# Altium project Tay cam.PrjPcb
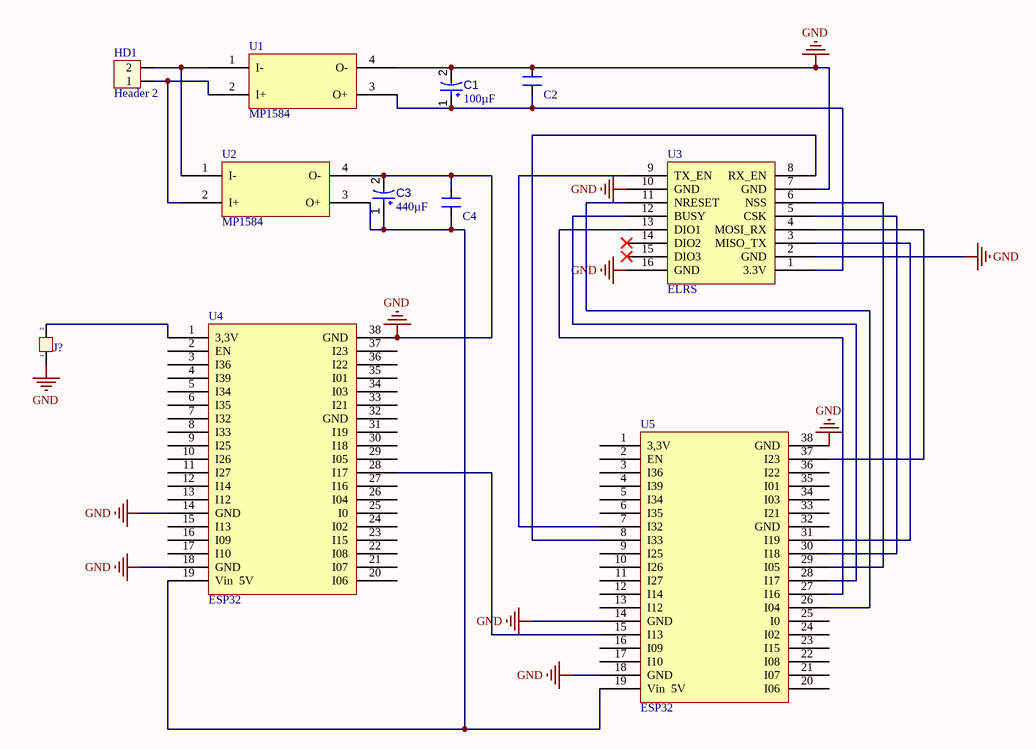
[diagram p0: SCH_TC.SchDoc]
1 sheet, 11 parts. Net scope: global (net labels, ports and power ports of the same name join across sheets).
Board file: PCB_taycam.PcbDoc

## Sheet SCH_TC.SchDoc
size A4; SheetNumber: 1; SheetTotal: 1

### Parts
C1  value 100µF  [CAPPR65-350-1150X800X1250]  (hidden comment: ECA1HM101)
C2  CAP gom  [CN1]  (value not drawn)
C3  value 440µF  [CAPPR65-350-1150X800X1250]  (hidden comment: ECA1HM101)
C4  CAP gom  [CN1]  (value not drawn)
HD1  Header 2  [HED2]
J?  Jumper 2  [jp2h]  (value not drawn)
U1  MP1584  [MP1584]
U2  MP1584  [MP1584]
U3  ELRS  [pcb_tc]
U4  ESP32  [ESP32]
U5  ESP32  [ESP32]

### Nets
GND: C1.2 C2.2 C3.2 C4.2 J?.1 U1.4(O-) U2.4(O-) U3.2(GND) U3.7(GND) U3.10(GND) U3.16(GND) U4.14(GND) U4.18(GND) U4.38(GND) U5.14(GND) U5.18(GND) U5.38(GND)
NetC1_1: C1.1 C2.1 U1.3(O+) U3.1(3.3V)
NetC3_1: C3.1 C4.1 U2.3(O+) U4.19(Vin__5V) U5.19(Vin__5V)
NetHD1_1: HD1.1 U1.2(I+) U2.2(I+)
NetHD1_2: HD1.2 U1.1(I-) U2.1(I-)
NetJ?_2: J?.2 U4.1(3,3V)
NetU3_3: U3.3(MISO_TX) U5.31(I19)
NetU3_4: U3.4(MOSI_RX) U5.37(I23)
NetU3_5: U3.5(CSK) U5.30(I18)
NetU3_6: U3.6(NSS) U5.29(I05)
NetU3_8: U3.8(RX_EN) U5.8(I33)
NetU3_9: U3.9(TX_EN) U5.7(I32)
NetU3_11: U3.11(NRESET) U5.26(I04)
NetU3_12: U3.12(BUSY) U5.28(I17)
NetU3_13: U3.13(DIO1) U5.27(I16)
NetU4_28: U4.28(I17) U5.15(I13)

Not connected (* = marked no-connect by the designer): U3 14(DIO2)* 15(DIO3)*; U4 2(EN) 3(I36) 4(I39) 5(I34) 6(I35) 7(I32) 8(I33) 9(I25) 10(I26) 11(I27) 12(I14) 13(I12) 15(I13) 16(I09) 17(I10) 20(I06) 21(I07) 22(I08) 23(I15) 24(I02) 25(I0) 26(I04) 27(I16) 29(I05) 30(I18) 31(I19) 32(GND) 33(I21) 34(I03) 35(I01) 36(I22) 37(I23); U5 1(3,3V) 2(EN) 3(I36) 4(I39) 5(I34) 6(I35) 9(I25) 10(I26) 11(I27) 12(I14) 13(I12) 16(I09) 17(I10) 20(I06) 21(I07) 22(I08) 23(I15) 24(I02) 25(I0) 32(GND) 33(I21) 34(I03) 35(I01) 36(I22)

### Library data of the parts
C1 C3 = CMP-001-00026-7: Aluminum Electrolytic Capacitor, 100 uF, +/- 20%, 50 V, -40 to 85 degC, 2-Pin THD, RoHS, Bulk; Manufacturer: Panasonic; Voltage Rating: 50V; Ripple Current: 250mA; Datasheet URL: https://industrial.panasonic.com/cdbs/www-data/pdf/RDF0000/ABA0000C1218.pdf; Lead Pitch: 3.5mm; Mounting Technology: TH; Package Description: 2-Pin Radial Lead, Dia 8 mm, Height 12.5 mm; Diameter: 8mm; Ripple Current (AC): 250mA; Manufacturer URL: http://www.panasonic.com/; Capacitor Type: Electrolytic; Max Operating Temperature: 85°C; Pins: 2; Min Operating Temperature: -40°C; Tolerance: 20%; Case/Package: Radial; Packaging: Bulk; Package Quantity: 200; Package Reference: CAPPR65-350-1150X800X1250; RoHS Compliant: True; Datasheet Version: Rev. 05, 10/2016
HD1 = Hed2: Header 2 (Green); Value: Header 2
J? = JP 2: Value: JP 2